# Altium project SimplicityExpansion.PrjPcb
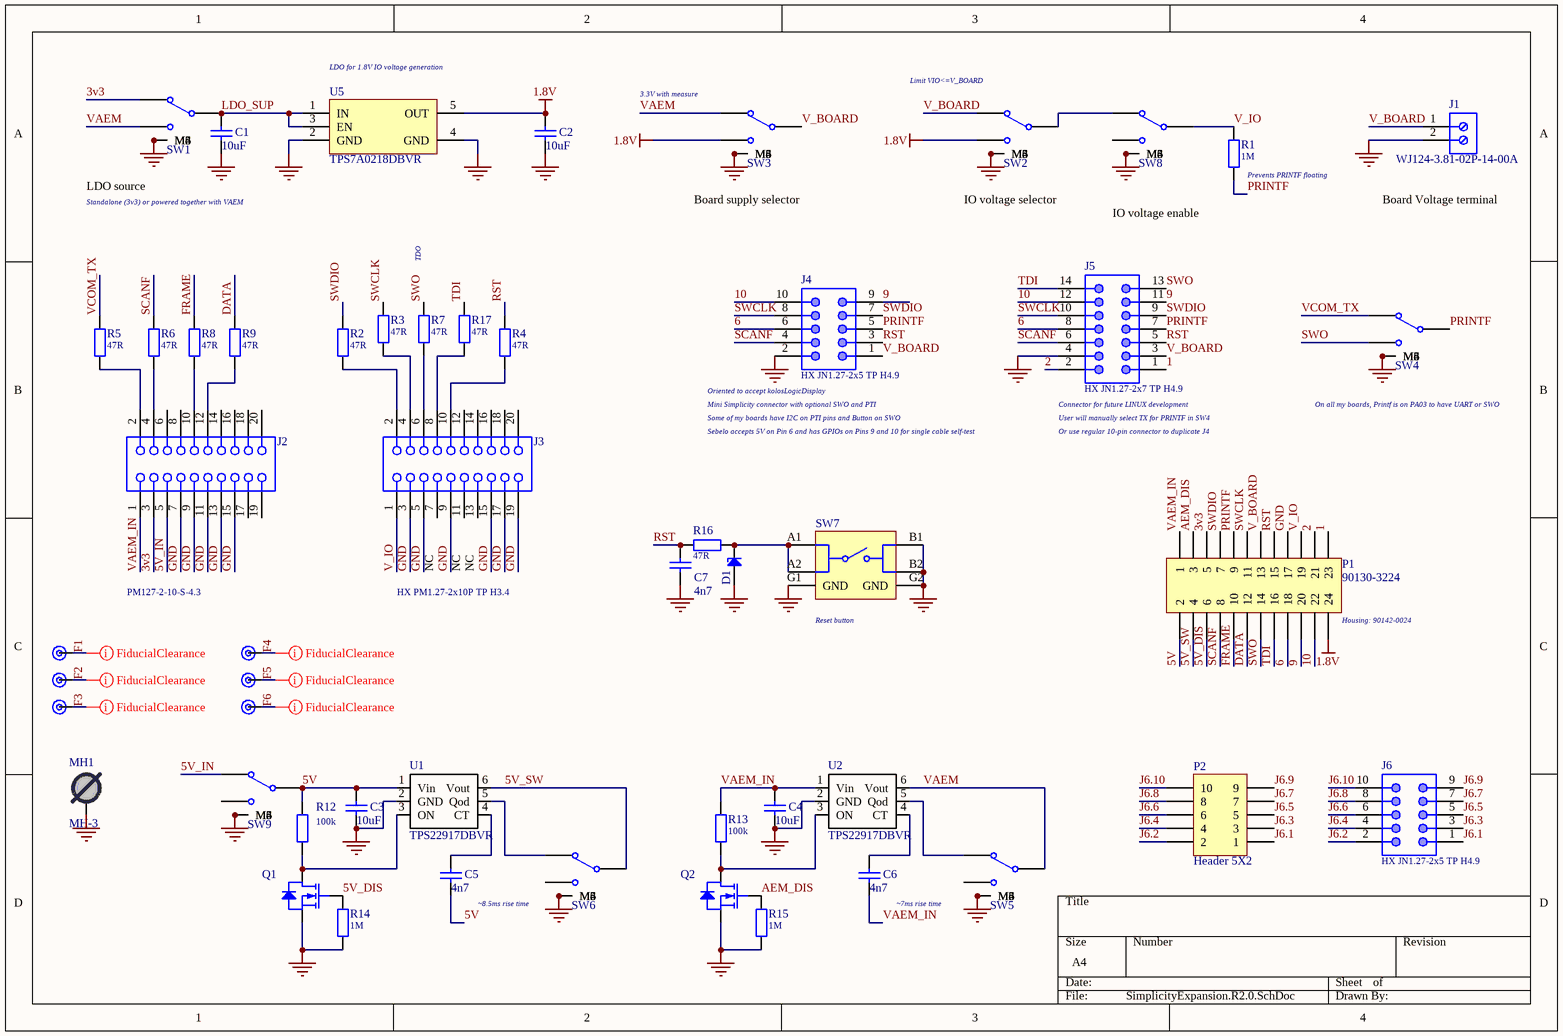
[diagram p0: SimplicityExpansion.R2.0.SchDoc]
1 sheet, 52 parts. Net scope: global (net labels, ports and power ports of the same name join across sheets).

## Sheet SimplicityExpansion.R2.0.SchDoc
size A4

### Parts
C1  value 10uF  [C SMD Ceramic 0603]  (hidden comment: CL10A106KP8NNNC)
C2  value 10uF  [C SMD Ceramic 0603]  (hidden comment: CL10A106KP8NNNC)
C3  value 10uF  [C SMD Ceramic 0603]  (hidden comment: CL10A106KP8NNNC)
C4  value 10uF  [C SMD Ceramic 0603]  (hidden comment: CL10A106KP8NNNC)
C5  value 4n7  [C SMD Ceramic 0603]  (hidden comment: 0603B472K500NT)
C6  value 4n7  [C SMD Ceramic 0603]  (hidden comment: 0603B472K500NT)
C7  value 4n7  [C SMD Ceramic 0603]  (hidden comment: 0603B472K500NT)
D1  H5VU10U  [DFN1006]  (value not drawn)
FIDUCIAL1  Fiducial  [Fiducial]  (value not drawn)  (no BOM)
FIDUCIAL2  Fiducial  [Fiducial]  (value not drawn)  (no BOM)
FIDUCIAL3  Fiducial  [Fiducial]  (value not drawn)  (no BOM)
FIDUCIAL4  Fiducial  [Fiducial]  (value not drawn)  (no BOM)
FIDUCIAL5  Fiducial  [Fiducial]  (value not drawn)  (no BOM)
FIDUCIAL6  Fiducial  [Fiducial]  (value not drawn)  (no BOM)
J1  WJ124-3.81-02P-14-00A  [691214310002]
J2  PM127-2-10-S-4.3  [62332021021]
J3  HX PM1.27-2x10P TP H3.4  [62332021021]
J4  HX JN1.27-2x5 TP H4.9  [62731020621]
J5  HX JN1.27-2x7 TP H4.9  [62731420621]
J6  HX JN1.27-2x5 TP H4.9  [62731020621]
MH1  MH-3  [MH R 3x4.5]  (no BOM)
P1  90130-3224  [Molex 24 pin 90130-3224]
P2  Header 5X2  [HDR2X5]  (no BOM)
Q1  HL2312  [SOT23-3-IPC - 1mm]  (value not drawn)
Q2  HL2312  [SOT23-3-IPC - 1mm]  (value not drawn)
R1  value 1M  [R SMD 0603 1%]  (hidden comment: 0603WAF1004T5E)
R2  value 47R  [R SMD 0603 1%]  (hidden comment: 0603WAF470JT5E)
R3  value 47R  [R SMD 0603 1%]  (hidden comment: 0603WAF470JT5E)
R4  value 47R  [R SMD 0603 1%]  (hidden comment: 0603WAF470JT5E)
R5  value 47R  [R SMD 0603 1%]  (hidden comment: 0603WAF470JT5E)
R6  value 47R  [R SMD 0603 1%]  (hidden comment: 0603WAF470JT5E)
R7  value 47R  [R SMD 0603 1%]  (hidden comment: 0603WAF470JT5E)
R8  value 47R  [R SMD 0603 1%]  (hidden comment: 0603WAF470JT5E)
R9  value 47R  [R SMD 0603 1%]  (hidden comment: 0603WAF470JT5E)
R12  value 100k  [R SMD 0603 1%]  (hidden comment: 0603WAF1003T5E)
R13  value 100k  [R SMD 0603 1%]  (hidden comment: 0603WAF1003T5E)
R14  value 1M  [R SMD 0603 1%]  (hidden comment: 0603WAF1004T5E)
R15  value 1M  [R SMD 0603 1%]  (hidden comment: 0603WAF1004T5E)
R16  value 47R  [R SMD 0603 1%]  (hidden comment: 0603WAF470JT5E)
R17  value 47R  [R SMD 0603 1%]  (hidden comment: 0603WAF470JT5E)
SW1  MK-12C02-G020  [450404015514]  (value not drawn)
SW2  MK-12C02-G020  [450404015514]  (value not drawn)
SW3  MK-12C02-G020  [450404015514]  (value not drawn)
SW4  MK-12C02-G020  [450404015514]  (value not drawn)
SW5  MK-12C02-G020  [450404015514]  (value not drawn)
SW6  MK-12C02-G020  [450404015514]  (value not drawn)
SW7  TS-1187A-B-A-B  [431181015816]  (value not drawn)
SW8  MK-12C02-G020  [450404015514]  (value not drawn)
SW9  MK-12C02-G020  [450404015514]  (value not drawn)
U1  TPS22917DBVR  [SOT23-6BL]
U2  TPS22917DBVR  [SOT23-6BL]
U5  TPS7A0218DBVR  [SOT23-5BL]

### Nets
1.8V: C2.2 P1.24 SW2.L2 SW3.L2 U5.5(OUT)
GND: C1.1 C2.1 C3.1 C4.1 C7.1 D1.2(A) J1.2 J2.7 J2.9 J2.11 J2.13 J2.15 J3.3 J3.5 J3.9 J3.15 J3.17 J3.19 J4.2 J5.4 MH1.1 P1.17 Q1.2(S) Q2.2(S) R14.2 R15.2 SW1.M3 SW1.M4 SW1.M5 SW1.M6 SW2.M3 SW2.M4 SW2.M5 SW2.M6 SW3.M3 SW3.M4 SW3.M5 SW3.M6 SW4.M3 SW4.M4 SW4.M5 SW4.M6 SW5.M3 SW5.M4 SW5.M5 SW5.M6 SW6.M3 SW6.M4 SW6.M5 SW6.M6 SW7.B1 SW7.B2 SW7.G1(GND) SW7.G2(GND) SW8.M3 SW8.M4 SW8.M5 SW8.M6 SW9.M3 SW9.M4 SW9.M5 SW9.M6 U1.2(GND) U2.2(GND) U5.2(GND) U5.4(GND)
1: J5.1 P1.23
2: J5.2 P1.21
3v3: J2.3 P1.5 SW1.L1
5V: C3.2 C5.1 P1.2 R12.2 SW9.COM U1.1(Vin)
5V_DIS: P1.6 Q1.1(G) R14.1
5V_IN: J2.5 SW9.L1
5V_SW: P1.4 SW6.COM U1.6(Vout)
6: J4.6 J5.8 P1.18
9: J4.9 J5.11 P1.20
10: J4.10 J5.12 P1.22
AEM_DIS: P1.3 Q2.1(G) R15.1
DATA: P1.12 R9.2
F1: FIDUCIAL1.1(F)
F2: FIDUCIAL2.1(F)
F3: FIDUCIAL3.1(F)
F4: FIDUCIAL4.1(F)
F5: FIDUCIAL5.1(F)
F6: FIDUCIAL6.1(F)
FRAME: P1.10 R8.2
J6.1: J6.1 P2.1
J6.2: J6.2 P2.2
J6.3: J6.3 P2.3
J6.4: J6.4 P2.4
J6.5: J6.5 P2.5
J6.6: J6.6 P2.6
J6.7: J6.7 P2.7
J6.8: J6.8 P2.8
J6.9: J6.9 P2.9
J6.10: J6.10 P2.10
LDO_SUP: C1.2 SW1.COM U5.1(IN) U5.3(EN)
PRINTF: J4.5 J5.7 P1.9 R1.2 SW4.COM
RST: C7.2 J4.3 J5.5 P1.15 R4.2 R16.2
SCANF: J4.4 J5.6 P1.8 R6.2
SWCLK: J4.8 J5.10 P1.11 R3.2
SWDIO: J4.7 J5.9 P1.7 R2.2
SWO: J5.13 P1.14 R7.2 SW4.L2
TDI: J5.14 P1.16 R17.2
V_BOARD: J1.1 J4.1 J5.3 P1.13 SW2.L1 SW3.COM
V_IO: J3.1 P1.19 R1.1 SW8.COM
VAEM: SW1.L2 SW3.L1 SW5.COM U2.6(Vout)
VAEM_IN: C4.2 C6.1 J2.1 P1.1 R13.2 U2.1(Vin)
VCOM_TX: R5.2 SW4.L1
NetC5_2: C5.2 U1.4(CT)
NetC6_2: C6.2 U2.4(CT)
NetD1_1: D1.1(C) R16.1 SW7.A1 SW7.A2
NetJ2_2: J2.2 R5.1
NetJ2_4: J2.4 R6.1
NetJ2_10: J2.10 R8.1
NetJ2_12: J2.12 R9.1
NetJ3_2: J3.2 R2.1
NetJ3_4: J3.4 R3.1
NetJ3_6: J3.6 R7.1
NetJ3_8: J3.8 R17.1
NetJ3_10: J3.10 R4.1
NetQ1_3: Q1.3(D) R12.1 U1.3(ON)
NetQ2_3: Q2.3(D) R13.1 U2.3(ON)
NetSW2_COM: SW2.COM SW8.L1
NetSW5_L1: SW5.L1 U2.5(Qod)
NetSW6_L1: SW6.L1 U1.5(Qod)

Not connected (* = marked no-connect by the designer): J2 6 8 14 16 17 18 19 20; J3 7 11 12 13 14 16 18 20; SW5 L2; SW6 L2; SW8 L2; SW9 L2

### Layout directives
rule Clearance Constraint [Clearance = 0.55mm]: F1, F2, F3, F4, F5, F6

### Notes on the sheet
- (near U5) LDO for 1.8V IO voltage generation
- (near SW3) 3.3V with measure
- (near SW2) Limit VIO<=V_BOARD
- (near R1) Prevents PRINTF floating
- (near SW1) LDO source
- Standalone (3v3) or powered together with VAEM
- (near SW3) Board supply selector
- (near SW2) IO voltage selector
- IO voltage enable
- Board Voltage terminal
- TDO
- (near J4) Mini Simplicity connector with optional SWO and PTI
- Some of my boards have I2C on PTI pins and Button on SWO
- Sebelo accepts 5V on Pin 6 and has GPIOs on Pins 9 and 10 for single cable self-test
- (near J4) Oriented to accept kolosLogicDisplay
- (near J5) Connector for future LINUX development
- (near J5) User will manually select TX for PRINTF in SW4
- Or use regular 10-pin connector to duplicate J4
- (near SW4) On all my boards, Printf is on PA03 to have UART or SWO
- NC
- (near SW7) Reset button
- (near P1) Housing: 90142-0024
- ~8.5ms rise time
- ~7ms rise time

### Library data of the parts
C1-C4 = 885012105012: 10uF, 6.3V, 0603, X5R, 20%; Part Number: 885012106006; Manufacturer: Wurth Elektronik; Price 1: 0.152; Price 100: 0.152; Price 1000: 0.152
C5-C7 = 885012105012: 4.7nF, 50V, 0603, X7R, 10%; Part Number: 885012206087; Manufacturer: Wurth Elektronik; Price 1: 0.03; Price 100: 0.03; Price 1000: 0.03
D1 = Zener: TVS diode, DFN1006-2, 0.6pF, 5V; Manufacturer: BORN; Part Number: ESD9L5.0ST5G-N; Price 1: 0.03; Price 100: 0.03; Price 1000: 0.03; Value: 5V
J1 = 691214310002: WR-TBL Serie 2143 Horizontal Entry Modular, Rising Cage Clamp, pitch 3.81mm, 2p; Manufacturer: Wurth Elektronik; Compliance: Lead free / RoHS; Modularity: Yes; PCB/Cable/Panel: PCB; Pin Number: 2; Rated Current [UL]: 10A; Working Voltage [UL]: 300VAC; ComponentLink1Description: Manufacturer; ComponentLink1URL: http://www.we-online.de; ComponentLink2URL: https://katalog.we-online.de/em/datasheet/691214310002.pdf; ComponentLink2Description: Datasheet; Mounting Technology: THT; Part Number: 691214310002; Packaging: Box; Operating Temperature: -40 to +105degC; Pitch: 3.81mm; Published Date: October 2019; Type: Horizontal; Application: Rising Cage Clamp; Price 1: 0.5; Price 100: 0.5; Price 1000: 0.5
J2 = 62332021021: Socket Header, SMT, pitch 1.27mm, Dual Row, Vertical, 20p; Manufacturer: Wurth Elektronik; Pin Number: 20; Rated Current: 1A; Working Voltage: 250VAC; Withstanding Voltage: 500VAC; Contact Resistance: 20mOhm; ComponentLink1Description: Manufacturer; ComponentLink1URL: http://www.we-online.de; ComponentLink2Description: Datasheet; ComponentLink2URL: https://www.we-online.com/catalog/datasheet/62332021021.pdf; Part Number: 62332021021; Published Date: May 2020; Pitch: 1.27mm; Operating Temperature: -40 to +105degC; Mounting Technology: SMT; Packaging: Tape and Reel; Gender: Socket Header; Row Number: Dual; Orientation: Vertical; Price 1: 0.5; Price 100: 0.4; Price 1000: 0.3
J3 = 62332021021: Socket Header, SMT, pitch 1.27mm, Dual Row, Vertical, 20p, H=3.4; Manufacturer: hanxia; Part Number: HX PM1.27-2x10P TP H3.4; Price 1: 0.5; Price 100: 0.4; Price 1000: 0.3
J4 J6 = 62731020621: WR-BHD Box Header, Male PCB side, pitch 1.27mm, SMT, Angled, 10p; Manufacturer: Wurth Elektronik; Working Voltage: 50VAC; Withstanding Voltage: 500VAC; Contact Resistance: 20mOhm; Pin Number: 10; Insulation Resistance: 1000MOhm; Rated Current: 1A; ComponentLink1Description: Manufacturer; ComponentLink1URL: http://www.we-online.de; ComponentLink2Description: Datasheet; ComponentLink2URL: https://www.we-online.com/catalog/datasheet/62731020621.pdf; Part Number: 62731020621; Published Date: August 2021; Pitch: 1.27mm; Operating Temperature: -40 to +105degC; Packaging: Tape and Reel; Gender: Male PCB side; Mounting Technology: SMT; Type: Angled; Length: 12.7mm; Price 1: 0.3; Price 100: 0.3; Price 1000: 0.3
J5 = 62731420621: WR-BHD Box Header, Male PCB side, pitch 1.27mm, SMT, Angled, 14p; Manufacturer: Wurth Elektronik; Working Voltage: 50VAC; Withstanding Voltage: 500VAC; Contact Resistance: 20mOhm; Pin Number: 14; Insulation Resistance: 1000MOhm; Rated Current: 1A; ComponentLink1Description: Manufacturer; ComponentLink1URL: http://www.we-online.de; ComponentLink2Description: Datasheet; ComponentLink2URL: https://www.we-online.com/catalog/datasheet/62731420621.pdf; Part Number: 62731420621; Published Date: August 2021; Pitch: 1.27mm; Operating Temperature: -40 to +105degC; Packaging: Tape and Reel; Gender: Male PCB side; Mounting Technology: SMT; Type: Angled; Length: 15.24mm; Price 1: 0.5; Price 100: 0.4; Price 1000: 0.3
MH1 = Mounting Hole
P1 = Header 12X2: Header, 12-Pin, Dual row; Manufacturer: Molex; Part Number: 90130-3224; Price 1: 6; Price 100: 5; Price 1000: 4
P2 = Header 5X2: Header, 5-Pin, Dual row; LatestRevisionDate: 17-Jul-2002; LatestRevisionNote: Re-released for DXP Platform.; Publisher: Altium Limited
Q1 Q2 = N-SOT23: N-MOSFET, SOT23, 20V, 5.5A, 1.8V operation; Manufacturer: Nexperia; Part Number: PMV16XN; Price 1: 0.08; Price 100: 0.07; Price 1000: 0.06
R1 R14 R15 = Resistor: 1MOhm, 50 V, 0603, 100 mW, ±1%; Part Number: CRCW06031M00FKTABC; Manufacturer: VISHAY; Price 1: 0.0123; Price 100: 0.0123; Price 1000: 0.0026
R2-R9 R16 R17 = Resistor: 47R, 50 V, 0603, 100mW, ±1%; Part Number: ERJ-3EKF47R0V; Manufacturer: PANASONIC; Price 1: 0.09; Price 100: 0.015; Price 1000: 0.009
R12 R13 = Resistor: 100k, 50 V, 0603, 100mW, ±1%; Manufacturer: Royal Ohm; Part Number: 0603WAF1003T5E; Price 1: 0.09; Price 100: 0.015; Price 1000: 0.009
SW1-SW6 SW8 SW9 = 450404015514: Slide Switch, SPDT; Manufacturer: Wurth Elektronik; Part Number: 450404015514; Price 1: 0.13; Price 100: 0.1; Price 1000: 0.08
SW7 = 431181015816: Tact Switch with ground terminal, 5x5mm, 160g; Manufacturer: Wurth Elektronik; Part Number: 431181015816; Price 1: 0.3; Price 100: 0.3; Price 1000: 0.3
U1 U2 = TPS22917x: Load Switch, 1–5.5V, 2-A, 80-mΩ, Ultra-Low Leakage; Manufacturer: Texas Instruments; Part Number: TPS22917DBVR; Price 1: 0.5; Price 100: 0.35; Price 1000: 0.17
U5 = TPS783xx: 200mA, nanopower-IQ (25 nA), low-dropout (LDO) voltage regulator with enable; Manufacturer: Texas Instruments; Price 1: 0.915; Price 100: 0.64; Price 1000: 0.417; Part Number: TPS7A0218DBVR